# Altium schematic sheet Top Sheet.SchDoc
size A4; DocumentNumber: 1; SheetNumber: 1; SheetTotal: 6
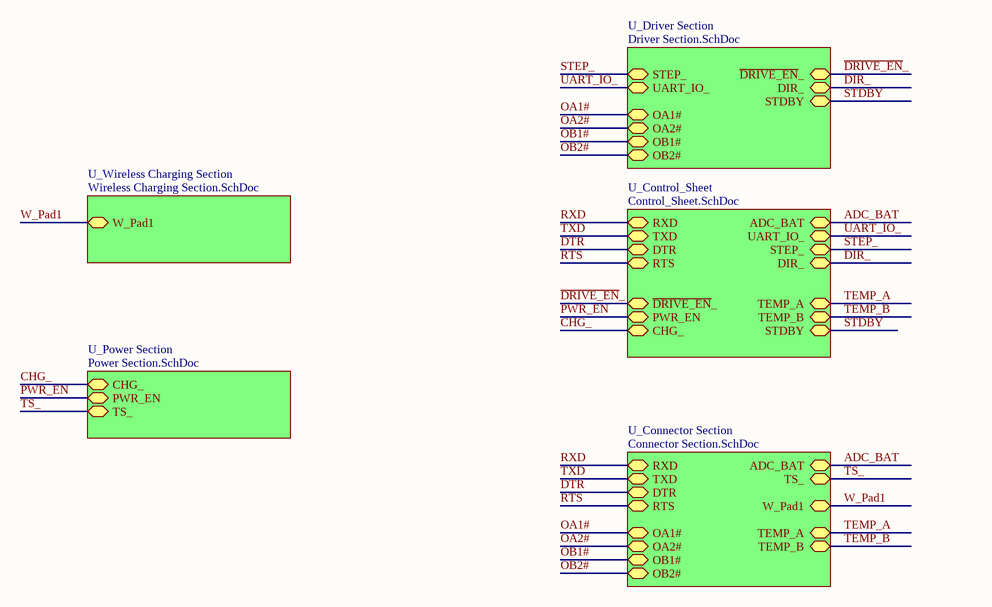
[diagram p0: Top Sheet.SchDoc]

## Sub-sheets
U_Connector Section = Connector Section.SchDoc: RXD (bidir), TXD (bidir), DTR (bidir), RTS (bidir), ADC_BAT (bidir), TS_ (bidir), W_Pad1 (bidir), TEMP_A (bidir), TEMP_B (bidir), OA2# (bidir), OB1# (bidir), OB2# (bidir), OA1# (bidir)
U_Control_Sheet = Control_Sheet.SchDoc: RXD (bidir), TXD (bidir), DTR (bidir), RTS (bidir), ADC_BAT (bidir), UART_IO_ (bidir), STEP_ (bidir), DIR_ (bidir), ~{DRI}~{VE_EN}_ (bidir), PWR_EN (bidir), CHG_ (bidir), TEMP_A (bidir), TEMP_B (bidir), STDBY (bidir)
U_Driver Section = Driver Section.SchDoc: STEP_ (bidir), DIR_ (bidir), UART_IO_ (bidir), ~{DRI}~{VE_EN}_ (bidir), STDBY (bidir), OB1# (bidir), OB2# (bidir), OA2# (bidir), OA1# (bidir)
U_Power Section = Power Section.SchDoc: PWR_EN (bidir), TS_ (bidir), CHG_ (bidir)
U_Wireless Charging Section = Wireless Charging Section.SchDoc: W_Pad1 (bidir)

## Nets
~{DRI}~{VE_EN}_: sheet U_Driver Section/~{DRI}~{VE_EN}_, sheet U_Control_Sheet/~{DRI}~{VE_EN}_
ADC_BAT: sheet U_Connector Section/ADC_BAT, sheet U_Control_Sheet/ADC_BAT
CHG_: sheet U_Power Section/CHG_, sheet U_Control_Sheet/CHG_
DIR_: sheet U_Driver Section/DIR_, sheet U_Control_Sheet/DIR_
DTR: sheet U_Connector Section/DTR, sheet U_Control_Sheet/DTR
OA1#: sheet U_Connector Section/OA1#, sheet U_Driver Section/OA1#
OA2#: sheet U_Connector Section/OA2#, sheet U_Driver Section/OA2#
OB1#: sheet U_Connector Section/OB1#, sheet U_Driver Section/OB1#
OB2#: sheet U_Connector Section/OB2#, sheet U_Driver Section/OB2#
PWR_EN: sheet U_Power Section/PWR_EN, sheet U_Control_Sheet/PWR_EN
RTS: sheet U_Connector Section/RTS, sheet U_Control_Sheet/RTS
RXD: sheet U_Connector Section/RXD, sheet U_Control_Sheet/RXD
STDBY: sheet U_Driver Section/STDBY, sheet U_Control_Sheet/STDBY
STEP_: sheet U_Driver Section/STEP_, sheet U_Control_Sheet/STEP_
TEMP_A: sheet U_Connector Section/TEMP_A, sheet U_Control_Sheet/TEMP_A
TEMP_B: sheet U_Connector Section/TEMP_B, sheet U_Control_Sheet/TEMP_B
TS_: sheet U_Power Section/TS_, sheet U_Connector Section/TS_
TXD: sheet U_Connector Section/TXD, sheet U_Control_Sheet/TXD
UART_IO_: sheet U_Driver Section/UART_IO_, sheet U_Control_Sheet/UART_IO_
W_Pad1: sheet U_Wireless Charging Section/W_Pad1, sheet U_Connector Section/W_Pad1